# Altium schematic sheet FPGA_J6_J8.SchDoc
size A3; SheetNumber: 3; SheetTotal: 18
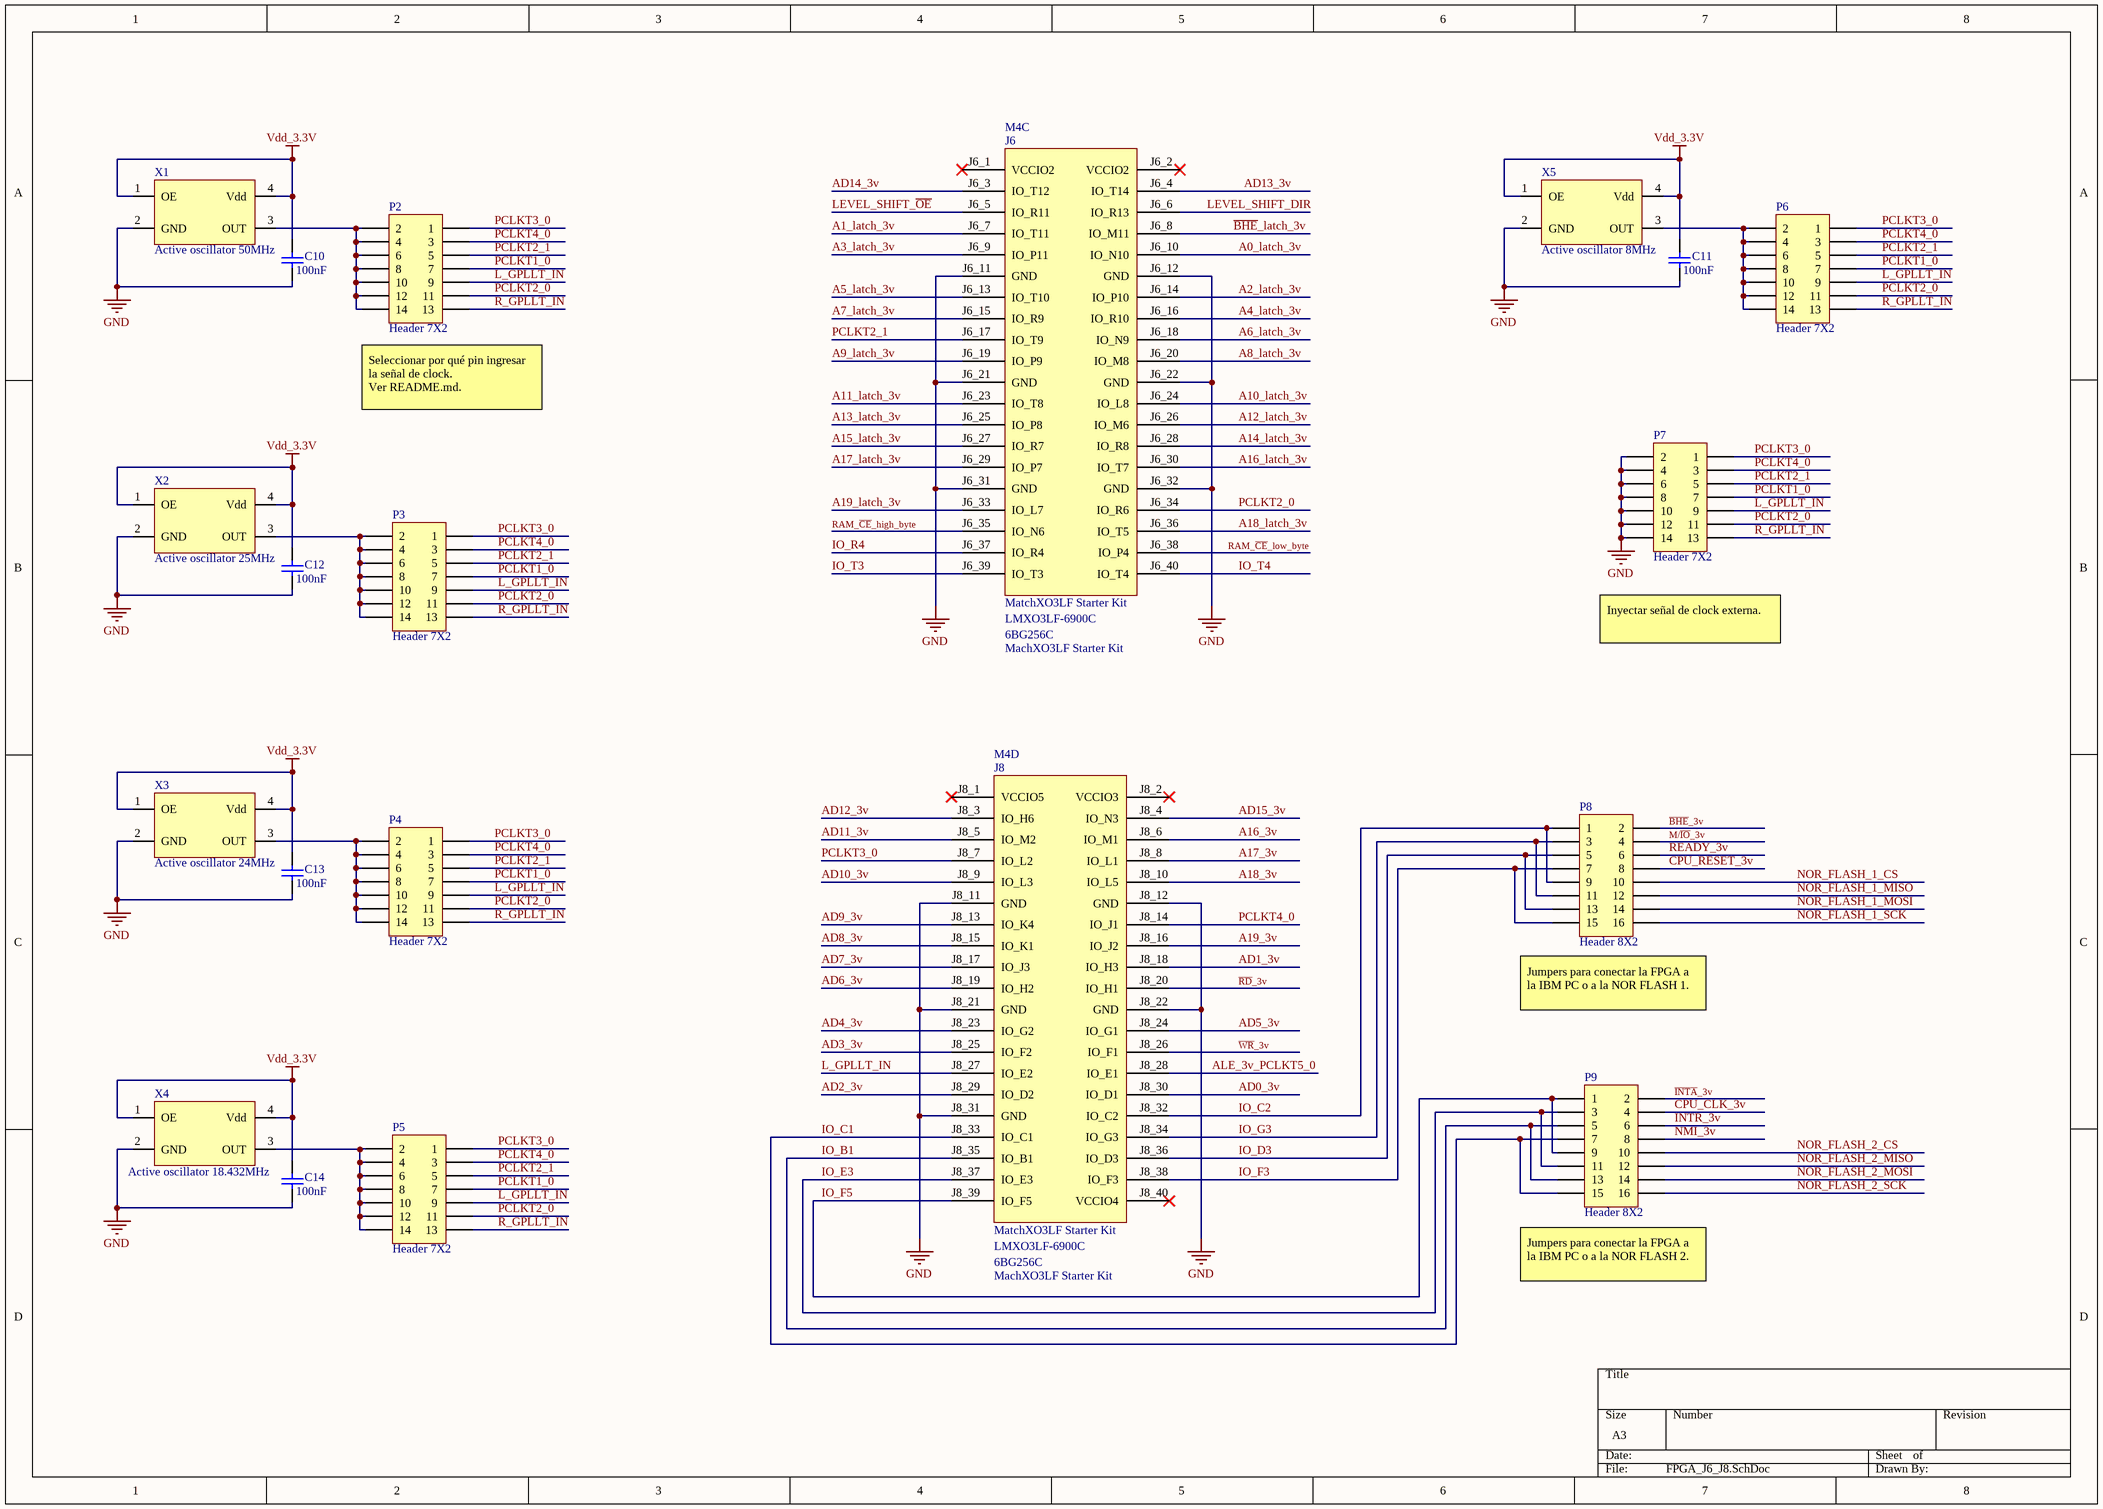
[diagram p0: FPGA_J6_J8.SchDoc]

## Parts
C10  value 100nF  [capacitor 0603]  (hidden comment: Ceramic capacitor)
C11  value 100nF  [capacitor 0603]  (hidden comment: Ceramic capacitor)
C12  value 100nF  [capacitor 0603]  (hidden comment: Ceramic capacitor)
C13  value 100nF  [capacitor 0603]  (hidden comment: Ceramic capacitor)
C14  value 100nF  [capacitor 0603]  (hidden comment: Ceramic capacitor)
M4  MachXO3LF Starter Kit  [Lattice MachXO3LF starter kit]  (parts C,D of 4)
P2  Header 7X2  [HDR2X7]
P3  Header 7X2  [HDR2X7]
P4  Header 7X2  [HDR2X7]
P5  Header 7X2  [HDR2X7]
P6  Header 7X2  [HDR2X7]
P7  Header 7X2  [HDR2X7]
P8  Header 8X2  [HDR2X8]
P9  Header 8X2  [HDR2X8]
X1  Active oscillator 50MHz  [Active oscillator 3.2mm x 2.5mm]
X2  Active oscillator 25MHz  [Active oscillator 3.2mm x 2.5mm]
X3  Active oscillator 24MHz  [Active oscillator 3.2mm x 2.5mm]
X4  Active oscillator 18.432MHz  [Active oscillator 3.2mm x 2.5mm]
X5  Active oscillator 8MHz  [Active oscillator 3.2mm x 2.5mm]

## Nets
GND: C10.1 C11.1 C12.1 C13.1 C14.1 M4.J6_11(GND) M4.J6_12(GND) M4.J6_21(GND) M4.J6_22(GND) M4.J6_31(GND) M4.J6_32(GND) M4.J8_11(GND) M4.J8_12(GND) M4.J8_21(GND) M4.J8_22(GND) M4.J8_31(GND) P7.2 P7.4 P7.6 P7.8 P7.10 P7.12 P7.14 X1.2(GND) X2.2(GND) X3.2(GND) X4.2(GND) X5.2(GND)
Vdd_3.3V: C10.2 C11.2 C12.2 C13.2 C14.2 X1.1(OE) X1.4(Vdd) X2.1(OE) X2.4(Vdd) X3.1(OE) X3.4(Vdd) X4.1(OE) X4.4(Vdd) X5.1(OE) X5.4(Vdd)
A0_latch_3v: M4.J6_10(IO_N10)
A1_latch_3v: M4.J6_7(IO_T11)
A2_latch_3v: M4.J6_14(IO_P10)
A3_latch_3v: M4.J6_9(IO_P11)
A4_latch_3v: M4.J6_16(IO_R10)
A5_latch_3v: M4.J6_13(IO_T10)
A6_latch_3v: M4.J6_18(IO_N9)
A7_latch_3v: M4.J6_15(IO_R9)
A8_latch_3v: M4.J6_20(IO_M8)
A9_latch_3v: M4.J6_19(IO_P9)
A10_latch_3v: M4.J6_24(IO_L8)
A11_latch_3v: M4.J6_23(IO_T8)
A12_latch_3v: M4.J6_26(IO_M6)
A13_latch_3v: M4.J6_25(IO_P8)
A14_latch_3v: M4.J6_28(IO_R8)
A15_latch_3v: M4.J6_27(IO_R7)
A16_3v: M4.J8_6(IO_M1)
A16_latch_3v: M4.J6_30(IO_T7)
A17_3v: M4.J8_8(IO_L1)
A17_latch_3v: M4.J6_29(IO_P7)
A18_3v: M4.J8_10(IO_L5)
A18_latch_3v: M4.J6_36(IO_T5)
A19_3v: M4.J8_16(IO_J2)
A19_latch_3v: M4.J6_33(IO_L7)
AD0_3v: M4.J8_30(IO_D1)
AD1_3v: M4.J8_18(IO_H3)
AD2_3v: M4.J8_29(IO_D2)
AD3_3v: M4.J8_25(IO_F2)
AD4_3v: M4.J8_23(IO_G2)
AD5_3v: M4.J8_24(IO_G1)
AD6_3v: M4.J8_19(IO_H2)
AD7_3v: M4.J8_17(IO_J3)
AD8_3v: M4.J8_15(IO_K1)
AD9_3v: M4.J8_13(IO_K4)
AD10_3v: M4.J8_9(IO_L3)
AD11_3v: M4.J8_5(IO_M2)
AD12_3v: M4.J8_3(IO_H6)
AD13_3v: M4.J6_4(IO_T14)
AD14_3v: M4.J6_3(IO_T12)
AD15_3v: M4.J8_4(IO_N3)
ALE_3v_PCLKT5_0: M4.J8_28(IO_E1)
~{BHE}_3v: P8.2
~{BHE}_latch_3v: M4.J6_8(IO_M11)
CPU_CLK_3v: P9.4
CPU_RESET_3v: P8.8
~{INTA}_3v: P9.2
INTR_3v: P9.6
IO_B1: M4.J8_35(IO_B1) P9.5 P9.13
IO_C1: M4.J8_33(IO_C1) P9.7 P9.15
IO_C2: M4.J8_32(IO_C2) P8.1 P8.9
IO_D3: M4.J8_36(IO_D3) P8.5 P8.13
IO_E3: M4.J8_37(IO_E3) P9.3 P9.11
IO_F3: M4.J8_38(IO_F3) P8.7 P8.15
IO_F5: M4.J8_39(IO_F5) P9.1 P9.9
IO_G3: M4.J8_34(IO_G3) P8.3 P8.11
IO_R4: M4.J6_37(IO_R4)
IO_T3: M4.J6_39(IO_T3)
IO_T4: M4.J6_40(IO_T4)
L_GPLLT_IN: M4.J8_27(IO_E2) P2.9 P3.9 P4.9 P5.9 P6.9 P7.9
LEVEL_SHIFT_DIR: M4.J6_6(IO_R13)
LEVEL_SHIFT_~{OE}: M4.J6_5(IO_R11)
M/~{IO}_3v: P8.4
NMI_3v: P9.8
NOR_FLASH_1_CS: P8.10
NOR_FLASH_1_MISO: P8.12
NOR_FLASH_1_MOSI: P8.14
NOR_FLASH_1_SCK: P8.16
NOR_FLASH_2_CS: P9.10
NOR_FLASH_2_MISO: P9.12
NOR_FLASH_2_MOSI: P9.14
NOR_FLASH_2_SCK: P9.16
PCLKT1_0: P2.7 P3.7 P4.7 P5.7 P6.7 P7.7
PCLKT2_0: M4.J6_34(IO_R6) P2.11 P3.11 P4.11 P5.11 P6.11 P7.11
PCLKT2_1: M4.J6_17(IO_T9) P2.5 P3.5 P4.5 P5.5 P6.5 P7.5
PCLKT3_0: M4.J8_7(IO_L2) P2.1 P3.1 P4.1 P5.1 P6.1 P7.1
PCLKT4_0: M4.J8_14(IO_J1) P2.3 P3.3 P4.3 P5.3 P6.3 P7.3
~{RD}_3v: M4.J8_20(IO_H1)
R_GPLLT_IN: P2.13 P3.13 P4.13 P5.13 P6.13 P7.13
RAM_~{CE}_high_byte: M4.J6_35(IO_N6)
RAM_~{CE}_low_byte: M4.J6_38(IO_P4)
READY_3v: P8.6
~{WR}_3v: M4.J8_26(IO_F1)
NetP2_2: P2.2 P2.4 P2.6 P2.8 P2.10 P2.12 P2.14 X1.3(OUT)
NetP3_2: P3.2 P3.4 P3.6 P3.8 P3.10 P3.12 P3.14 X2.3(OUT)
NetP4_2: P4.2 P4.4 P4.6 P4.8 P4.10 P4.12 P4.14 X3.3(OUT)
NetP5_2: P5.2 P5.4 P5.6 P5.8 P5.10 P5.12 P5.14 X4.3(OUT)
NetP6_2: P6.2 P6.4 P6.6 P6.8 P6.10 P6.12 P6.14 X5.3(OUT)

Not connected (* = marked no-connect by the designer): M4 J6_1(VCCIO2)* J6_2(VCCIO2)* J8_1(VCCIO5)* J8_2(VCCIO3)* J8_40(VCCIO4)*

## Notes on the sheet
- (near P2) Seleccionar por qué pin ingresar la señal de clock.
  Ver README.md.
- Inyectar señal de clock externa.
- (near P8) Jumpers para conectar la FPGA a la IBM PC o a la NOR FLASH 1.
- (near P9) Jumpers para conectar la FPGA a la IBM PC o a la NOR FLASH 2.
- (in symbol Lattice_MachXO3LF_starter_kit, part C) J6; MatchXO3LF Starter Kit; LMXO3LF-6900C; 6BG256C
- (in symbol Lattice_MachXO3LF_starter_kit, part D) J8; MatchXO3LF Starter Kit; LMXO3LF-6900C; 6BG256C

## Library data of the parts
C10-C14 = Ceramic capacitor: Multilayer ceramic capacitor; V: 50; LCSC part: C14663; Package: 0603
M4 = Lattice_MachXO3LF_starter_kit: FPGA development board - MachXO3LF Starter Kit
P2-P7 = Header 7X2: Header, 7-Pin, Dual row; LatestRevisionDate: 17-Jul-2002; LatestRevisionNote: Re-released for DXP Platform.; Publisher: Altium Limited
P8 P9 = Header 8X2: Header, 8-Pin, Dual row; LatestRevisionDate: 17-Jul-2002; LatestRevisionNote: Re-released for DXP Platform.; Publisher: Altium Limited
X1-X5 = Active oscillator